# Altium schematic sheet RS-232 Tranceiver Section.SchDoc
size A4; DocumentNumber: 19; SheetNumber: 19; SheetTotal: 28
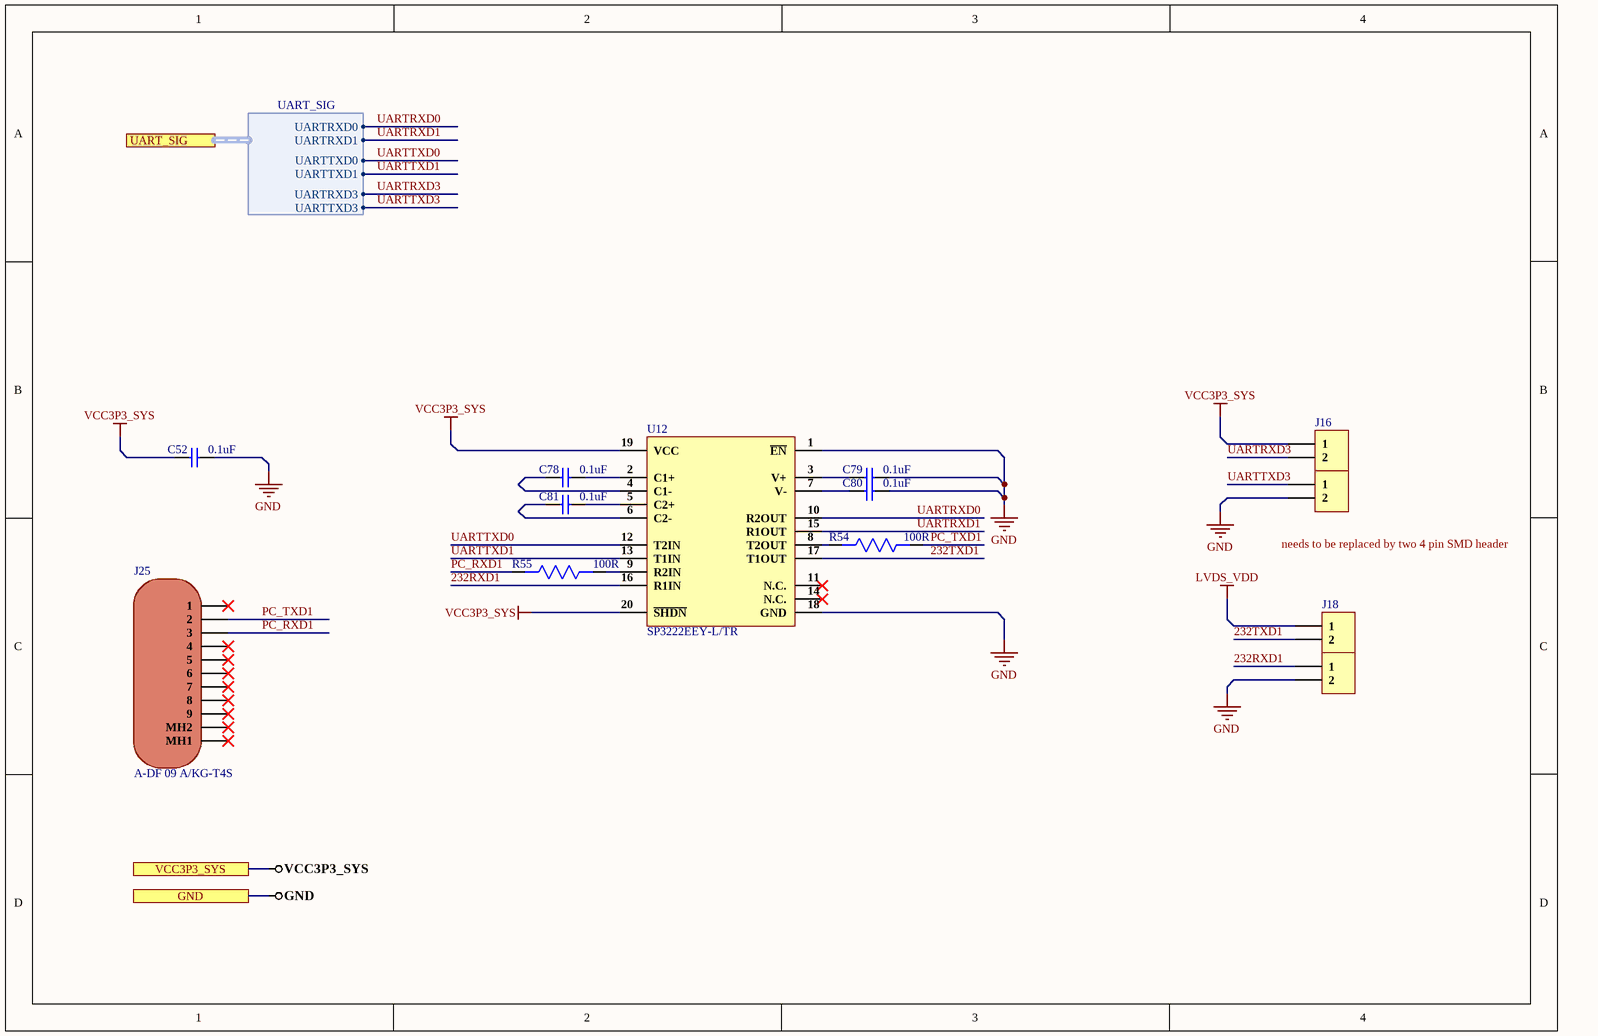
[diagram p0: RS-232 Tranceiver Section.SchDoc]

## Parts
C52  0.1uF  [Cap0603]
C78  0.1uF  [Cap0603]
C79  0.1uF  [Cap0603]
C80  0.1uF  [Cap0603]
C81  0.1uF  [Cap0603]
J16  S2B-XH-A(LF)(SN)  [S2B-XH-A(LF)(SN)]  (value not drawn)
J17  S2B-XH-A(LF)(SN)  [S2B-XH-A(LF)(SN)]  (value not drawn)
J18  S2B-XH-A(LF)(SN)  [S2B-XH-A(LF)(SN)]  (value not drawn)
J19  S2B-XH-A(LF)(SN)  [S2B-XH-A(LF)(SN)]  (value not drawn)
J25  A-DF 09 A/KG-T4S  [A-DF 09 A/KG-T4S]
R54  100R  [Res0603]
R55  100R  [Res0603]
U12  SP3222EEY-L/TR  [20-TSSOP]

## Ports
GND, UART_SIG (harness UART_SIG), VCC3P3_SYS

## Harnesses
UART_SIG: UARTRXD0, UARTRXD1, UARTTXD0, UARTTXD1, UARTRXD3, UARTTXD3

## Nets
GND: C52.2 C79.2 C80.2 J17.2 J19.2 U12.1(~{EN}) U12.18(GND) ; port GND
LVDS_VDD: J18.1
VCC3P3_SYS: C52.1 J16.1 U12.19(VCC) U12.20(~{SHDN}) ; port VCC3P3_SYS
232RXD1: J19.1 U12.16(R1IN)
232TXD1: J18.2 U12.17(T1OUT)
PC_RXD1: J25.3 R55.2
PC_TXD1: J25.2 R54.1
UARTRXD0: U12.10(R2OUT) ; port UART_SIG.UARTRXD0
UARTRXD1: U12.15(R1OUT) ; port UART_SIG.UARTRXD1
UARTRXD3: J16.2 ; port UART_SIG.UARTRXD3
UARTTXD0: U12.12(T2IN) ; port UART_SIG.UARTTXD0
UARTTXD1: U12.13(T1IN) ; port UART_SIG.UARTTXD1
UARTTXD3: J17.1 ; port UART_SIG.UARTTXD3
NetC78_1: C78.1 U12.4(C1-)
NetC78_2: C78.2 U12.2(C1+)
NetC79_1: C79.1 U12.3(V+)
NetC80_1: C80.1 U12.7(V-)
NetC81_1: C81.1 U12.6(C2-)
NetC81_2: C81.2 U12.5(C2+)
NetR54_2: R54.2 U12.8(T2OUT)
NetR55_1: R55.1 U12.9(R2IN)

Not connected (* = marked no-connect by the designer): J25 1* 4* 5* 6* 7* 8* 9* MH1* MH2*; U12 11(N.C.)* 14(N.C.)*

## Notes on the sheet
- (near J17) needs to be replaced by two 4 pin SMD header

## Library data of the parts
C52 C78-C81 = CC0603ZRY5V9BB104: CAP CER 0.1UF 50V Y5V 0603; Manufacturer: Yageo; Capacitance: 100nF; Tolerance: 80%; Supplier 1: Digi-Key; Manufacturer Part Number: CC0603ZRY5V9BB104; Stock 1: 15000880; Pricing 1: 1=0.1, 10=0.075, 100=0.0334, 500=0.02386, 1000=0.01874 (USD); Mount: Surface Mount; Case/Package: 0603; Number of Pins: 2; Case Code (Metric): 1608; Case Code (Imperial): 0603; Min Operating Temperature: -30°C; Max Operating Temperature: 85°C; Dielectric: Y5V; Voltage Rating: 50V; Package Quantity: 1; Packaging: Tape and Reel; Voltage Rating (DC): 50V; Termination: SMD/SMT; Composition: Ceramic; Voltage: 50V; Length: 1.6mm; Height: 0.8mm; Width: 0.031inch; Thickness: 0.035inch; Depth: 0.8mm; Radiation Hardening: No; REACH SVHC: No SVHC; Lead Free: Lead Free; Halogen Free: Halogen Free; ComponentLink1URL: http://www.yageo.com/documents/recent/UPY-GPHC_Y5V_6.3V-to-50V_8.pdf?src-supplier=Digi-Key; ComponentLink1Description: http://www.yageo.com/documents/recent/UPY-GPHC_Y5V_6.3V-to-50V_8.pdf?src-supplier=Digi-Key; ComponentLink2URL: http://www.yageo.com/documents/recent/UPY-GPHC_Y5V_6.3V-to-50V_5.pdf?src-supplier=Avnet+Europe; ComponentLink2Description: http://www.yageo.com/documents/recent/UPY-GPHC_Y5V_6.3V-to-50V_5.pdf?src-supplier=Avnet+Europe; ComponentLink3URL: https://www.verical.com/server-webapp/html/getDatasheet?partID=403611&src-supplier=Verical; ComponentLink3Description: https://www.verical.com/server-webapp/html/getDatasheet?partID=403611&src-supplier=Verical; ComponentLink4URL: http://www.mouser.com/ds/2/447/Yageo_UPY-GP_NP0_16V-to-50V_9-358835.pdf?src-supplier=Mouser; ComponentLink4Description: http://www.mouser.com/ds/2/447/Yageo_UPY-GP_NP0_16V-to-50V_9-358835.pdf?src-supplier=Mouser; ComponentLink5URL: http://www.farnell.com/datasheets/1132289.pdf?src-supplier=Element14; ComponentLink5Description: http://www.farnell.com/datasheets/1132289.pdf?src-supplier=Element14; Supplier Part Number 1: 311-1343-1-ND
J16-J19 = S2B-XH-A(LF)(SN): CONN HEADER R/A 2POS 2.5MM; Manufacturer: JST; Current Rating: 3A; Contact Resistance: 20mR; Voltage Rating (AC): 250V; Number of Positions: 2; Insulation Resistance: 1GR; Gender: Male; Connector Type: Male Pin; Wire/Cable Gauge: 22AWG; Supplier 1: Digi-Key; Manufacturer Part Number: S2B-XH-A(LF)(SN); RoHS: Yes; Category: Headers and Wire Housings; Stock 1: 44898; Pricing 1: 1=0.17000, 10=0.16200, 100=0.11260, 500=0.09524, 1000=0.07792, 5000=0.06927, 10000=0.06277 (USD); Mount: Through Hole; Contact Material: Brass; Contact Plating: Tin,Copper,Lead; Color: Natural; Housing Color: White; Housing Material: Polyamide; Min Operating Temperature: -25°C; Max Operating Temperature: 85°C; Number of Rows: 1; Voltage Rating: 250V; Termination: Press-Fit; Number of Contacts: 2; Max Current Rating: 3A; Package Quantity: 1000; Packaging: Bulk; Max Voltage Rating (AC): 250V; Max Voltage Rating (DC): 250V; Orientation: Right Angle; Length: 7.4mm; Pitch: 2.5mm; Lead Pitch: 2.5mm; Depth: 11.5mm; REACH SVHC: No SVHC; Lead Free: Lead Free; ComponentLink1URL: https://datasheet.ciiva.com/16208/s2b-xh-alfsn-16208978.pdf?src-supplier=Future+Electronics; ComponentLink1Description: https://datasheet.ciiva.com/16208/s2b-xh-alfsn-16208978.pdf?src-supplier=Future+Electronics; ComponentLink2URL: https://datasheet.ciiva.com/8052/1684882-8052211.pdf?src-supplier=Element14; ComponentLink2Description: https://datasheet.ciiva.com/8052/1684882-8052211.pdf?src-supplier=Element14; ComponentLink3URL: https://datasheet.ciiva.com/11746/0900766b8082f560-11746947.pdf?src-supplier=RSComponents; ComponentLink3Description: https://datasheet.ciiva.com/11746/0900766b8082f560-11746947.pdf?src-supplier=RSComponents; ComponentLink4URL: https://datasheet.ciiva.com/26894/getdatasheetpartid-640270-26894603.pdf?src-supplier=Verical; ComponentLink4Description: https://datasheet.ciiva.com/26894/getdatasheetpartid-640270-26894603.pdf?src-supplier=Verical; ComponentLink5URL: https://datasheet.ciiva.com/26924/getdatasheetpartid-645395-26924076.pdf?src-supplier=Verical; ComponentLink5Description: https://datasheet.ciiva.com/26924/getdatasheetpartid-645395-26924076.pdf?src-supplier=Verical; ComponentLink6URL: https://datasheet.ciiva.com/26894/getdatasheetpartid-441330-26894909.pdf?src-supplier=Verical; ComponentLink6Description: https://datasheet.ciiva.com/26894/getdatasheetpartid-441330-26894909.pdf?src-supplier=Verical; ComponentLink7URL: https://datasheet.ciiva.com/726/exh-726412.pdf?src-supplier=Digi-Key; ComponentLink7Description: https://datasheet.ciiva.com/726/exh-726412.pdf?src-supplier=Digi-Key; ComponentLink8URL: https://datasheet.ciiva.com/20207/523653-20207183.pdf?src-supplier=Rapid+Electronics; ComponentLink8Description: https://datasheet.ciiva.com/20207/523653-20207183.pdf?src-supplier=Rapid+Electronics; Supplier Part Number 1: 455-2257-ND
J25 = A-DF 09 A/KG-T4S: CONN D-SUB RCPT 9POS R/A SOLDER; Manufacturer: Assmann; Connector Type: D-Sub,Receptacle,Signal; Number of Positions: 9; Voltage Rating: 250V; Current Rating: 3A; Supplier 1: Digi-Key; Manufacturer Part Number: A-DF 09 A/KG-T4S; RoHS: Yes; Category: D-Sub Connectors; Stock 1: 19005; Pricing 1: 1=0.79000, 10=0.74200, 25=0.66800, 50=0.59380, 100=0.56910, 250=0.51964, 500=0.49490, 1000=0.40829, 2500=0.37118 (USD); Mount: Through Hole; Number of Pins: 9; Housing Material: PBT; Color: Black; Contact Plating: Gold; Contact Material: Copper Alloy; Min Operating Temperature: -55°C; Max Operating Temperature: 105°C; Packaging: Tray; Number of Rows: 2; Termination: Solder; Lead Free: Lead Free; Flammability Rating: UL94 V-0; ComponentLink1URL: http://www.assmann-wsw.com/fileadmin/datasheets/ASS_4888_CO.pdf?src-supplier=Digi-Key; ComponentLink1Description: http://www.assmann-wsw.com/fileadmin/datasheets/ASS_4888_CO.pdf?src-supplier=Digi-Key; Supplier Part Number 1: AE10924-ND
R54 R55 = RC0603FR-07100RL: RES SMD 100 OHM 1% 1/10W 0603; Manufacturer: Yageo; Temperature Coefficient: 100ppm/°C; Voltage Rating (DC): 50V; Power Rating: 100mW; Supplier 1: Arrow Electronics; Manufacturer Part Number: RC0603FR-07100RL; RoHS: Yes; Category: Chip SMD Resistors; Stock 1: 3800000; Pricing 1: 5000=0.00300, 5000=0.00200, 5000=0.00450, 50000=0.00410, 500000=0.00230, 2500000=0.00140 (USD); Case/Package: 0603; Number of Pins: 2; Case Code (Imperial): 0603; Case Code (Metric): 1608; Size Code: 0603; Min Operating Temperature: -55°C; Max Operating Temperature: 155°C; Resistance: 100R; Tolerance: 1%; Resistor Type: Thick Film; Packaging: Tape and Reel; Voltage Rating: 50V; Termination: SMD/SMT; Features: Moisture Resistant; Series: RC; Max Power Dissipation: 100mW; Number of Terminations: 2; Construction: Rectangular; Resistance Tolerance: 1%; Technology: THICK FILM; Length: 1.6mm; Width: 0.8mm; Height: 0.45mm; Depth: 0.8mm; REACH SVHC: Unknown; Lead Free: Lead Free; RoHS Compliant: Yes; Military Standard: Not; Supplier Part Number 1: RC0603FR-07100RL
U12 = SP3222EEY-L/TR: IC TRANSCEIVER FULL 2/2 20TSSOP; Manufacturer: MaxLinear; Supplier 1: Digi-Key; Manufacturer Part Number: SP3222EEY-L/TR; RoHS: Yes; Category: Interface ICs; Stock 1: 1669; Pricing 1: 1=1.75000, 10=1.57600, 25=1.48680, 100=1.26660, 250=1.18932, 500=1.04066, 1000=0.86226 (USD); RoHS Compliant: Yes; Supplier Part Number 1: 1016-1794-1-ND